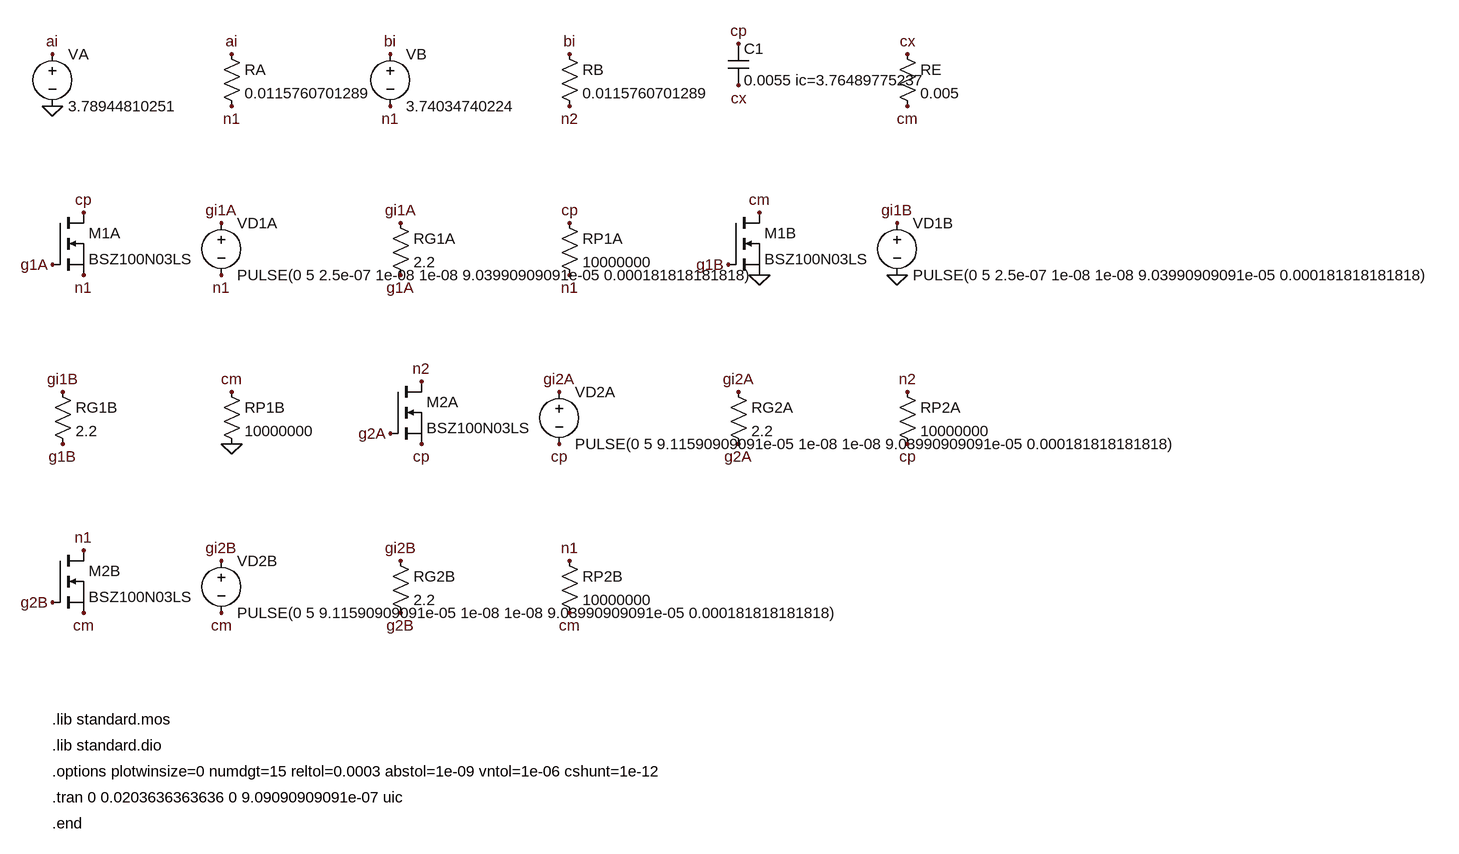
[diagram p0: schematic flying_cap_real.asc]
flying_cap_real.asc, the LTspice schematic file:
Version 4
SHEET 1 1880 1200
SYMBOL voltage 160 120 R0
SYMATTR InstName VA
SYMATTR Value 3.78944810251
FLAG 160 136 ai
FLAG 160 216 0
SYMBOL res 420 120 R0
SYMATTR InstName RA
SYMATTR Value 0.0115760701289
FLAG 436 136 ai
FLAG 436 216 n1
SYMBOL voltage 680 120 R0
SYMATTR InstName VB
SYMATTR Value 3.74034740224
FLAG 680 136 bi
FLAG 680 216 n1
SYMBOL res 940 120 R0
SYMATTR InstName RB
SYMATTR Value 0.0115760701289
FLAG 956 136 bi
FLAG 956 216 n2
SYMBOL cap 1200 120 R0
SYMATTR InstName C1
SYMATTR Value 0.0055 ic=3.76489775237
FLAG 1216 120 cp
FLAG 1216 184 cx
SYMBOL res 1460 120 R0
SYMATTR InstName RE
SYMATTR Value 0.005
FLAG 1476 136 cx
FLAG 1476 216 cm
SYMBOL nmos 160 380 R0
SYMATTR InstName M1A
SYMATTR Value BSZ100N03LS
FLAG 208 380 cp
FLAG 160 460 g1A
FLAG 208 476 n1
SYMBOL voltage 420 380 R0
SYMATTR InstName VD1A
SYMATTR Value PULSE(0 5 2.5e-07 1e-08 1e-08 9.03990909091e-05 0.000181818181818)
FLAG 420 396 gi1A
FLAG 420 476 n1
SYMBOL res 680 380 R0
SYMATTR InstName RG1A
SYMATTR Value 2.2
FLAG 696 396 gi1A
FLAG 696 476 g1A
SYMBOL res 940 380 R0
SYMATTR InstName RP1A
SYMATTR Value 10000000
FLAG 956 396 cp
FLAG 956 476 n1
SYMBOL nmos 1200 380 R0
SYMATTR InstName M1B
SYMATTR Value BSZ100N03LS
FLAG 1248 380 cm
FLAG 1200 460 g1B
FLAG 1248 476 0
SYMBOL voltage 1460 380 R0
SYMATTR InstName VD1B
SYMATTR Value PULSE(0 5 2.5e-07 1e-08 1e-08 9.03990909091e-05 0.000181818181818)
FLAG 1460 396 gi1B
FLAG 1460 476 0
SYMBOL res 160 640 R0
SYMATTR InstName RG1B
SYMATTR Value 2.2
FLAG 176 656 gi1B
FLAG 176 736 g1B
SYMBOL res 420 640 R0
SYMATTR InstName RP1B
SYMATTR Value 10000000
FLAG 436 656 cm
FLAG 436 736 0
SYMBOL nmos 680 640 R0
SYMATTR InstName M2A
SYMATTR Value BSZ100N03LS
FLAG 728 640 n2
FLAG 680 720 g2A
FLAG 728 736 cp
SYMBOL voltage 940 640 R0
SYMATTR InstName VD2A
SYMATTR Value PULSE(0 5 9.11590909091e-05 1e-08 1e-08 9.03990909091e-05 0.000181818181818)
FLAG 940 656 gi2A
FLAG 940 736 cp
SYMBOL res 1200 640 R0
SYMATTR InstName RG2A
SYMATTR Value 2.2
FLAG 1216 656 gi2A
FLAG 1216 736 g2A
SYMBOL res 1460 640 R0
SYMATTR InstName RP2A
SYMATTR Value 10000000
FLAG 1476 656 n2
FLAG 1476 736 cp
SYMBOL nmos 160 900 R0
SYMATTR InstName M2B
SYMATTR Value BSZ100N03LS
FLAG 208 900 n1
FLAG 160 980 g2B
FLAG 208 996 cm
SYMBOL voltage 420 900 R0
SYMATTR InstName VD2B
SYMATTR Value PULSE(0 5 9.11590909091e-05 1e-08 1e-08 9.03990909091e-05 0.000181818181818)
FLAG 420 916 gi2B
FLAG 420 996 cm
SYMBOL res 680 900 R0
SYMATTR InstName RG2B
SYMATTR Value 2.2
FLAG 696 916 gi2B
FLAG 696 996 g2B
SYMBOL res 940 900 R0
SYMATTR InstName RP2B
SYMATTR Value 10000000
FLAG 956 916 n1
FLAG 956 996 cm
TEXT 160 1160 Left 2 !.lib standard.mos
TEXT 160 1200 Left 2 !.lib standard.dio
TEXT 160 1240 Left 2 !.options plotwinsize=0 numdgt=15 reltol=0.0003 abstol=1e-09 vntol=1e-06 cshunt=1e-12
TEXT 160 1280 Left 2 !.tran 0 0.0203636363636 0 9.09090909091e-07 uic
TEXT 160 1320 Left 2 !.end

The netlist it stands for:
* flying_cap_real.asc
VA ai 0 3.78944810251
RA ai n1 0.0115760701289
VB bi n1 3.74034740224
RB bi n2 0.0115760701289
C1 cp cx 0.0055 ic=3.76489775237
RE cx cm 0.005
M1A cp g1A n1 n1 BSZ100N03LS
VD1A gi1A n1 PULSE(0 5 2.5e-07 1e-08 1e-08 9.03990909091e-05 0.000181818181818)
RG1A gi1A g1A 2.2
RP1A cp n1 10000000
M1B cm g1B 0 0 BSZ100N03LS
VD1B gi1B 0 PULSE(0 5 2.5e-07 1e-08 1e-08 9.03990909091e-05 0.000181818181818)
RG1B gi1B g1B 2.2
RP1B cm 0 10000000
M2A n2 g2A cp cp BSZ100N03LS
VD2A gi2A cp PULSE(0 5 9.11590909091e-05 1e-08 1e-08 9.03990909091e-05 0.000181818181818)
RG2A gi2A g2A 2.2
RP2A n2 cp 10000000
M2B n1 g2B cm cm BSZ100N03LS
VD2B gi2B cm PULSE(0 5 9.11590909091e-05 1e-08 1e-08 9.03990909091e-05 0.000181818181818)
RG2B gi2B g2B 2.2
RP2B n1 cm 10000000
.model NMOS NMOS
.model PMOS PMOS
.lib standard.mos
.lib standard.mos
.lib standard.dio
.options plotwinsize=0 numdgt=15 reltol=0.0003 abstol=1e-09 vntol=1e-06 cshunt=1e-12
.tran 0 0.0203636363636 0 9.09090909091e-07 uic
.end
.backanno
.end